# Altium schematic sheet 04_I2C_EEPROM.SchDoc
size A4
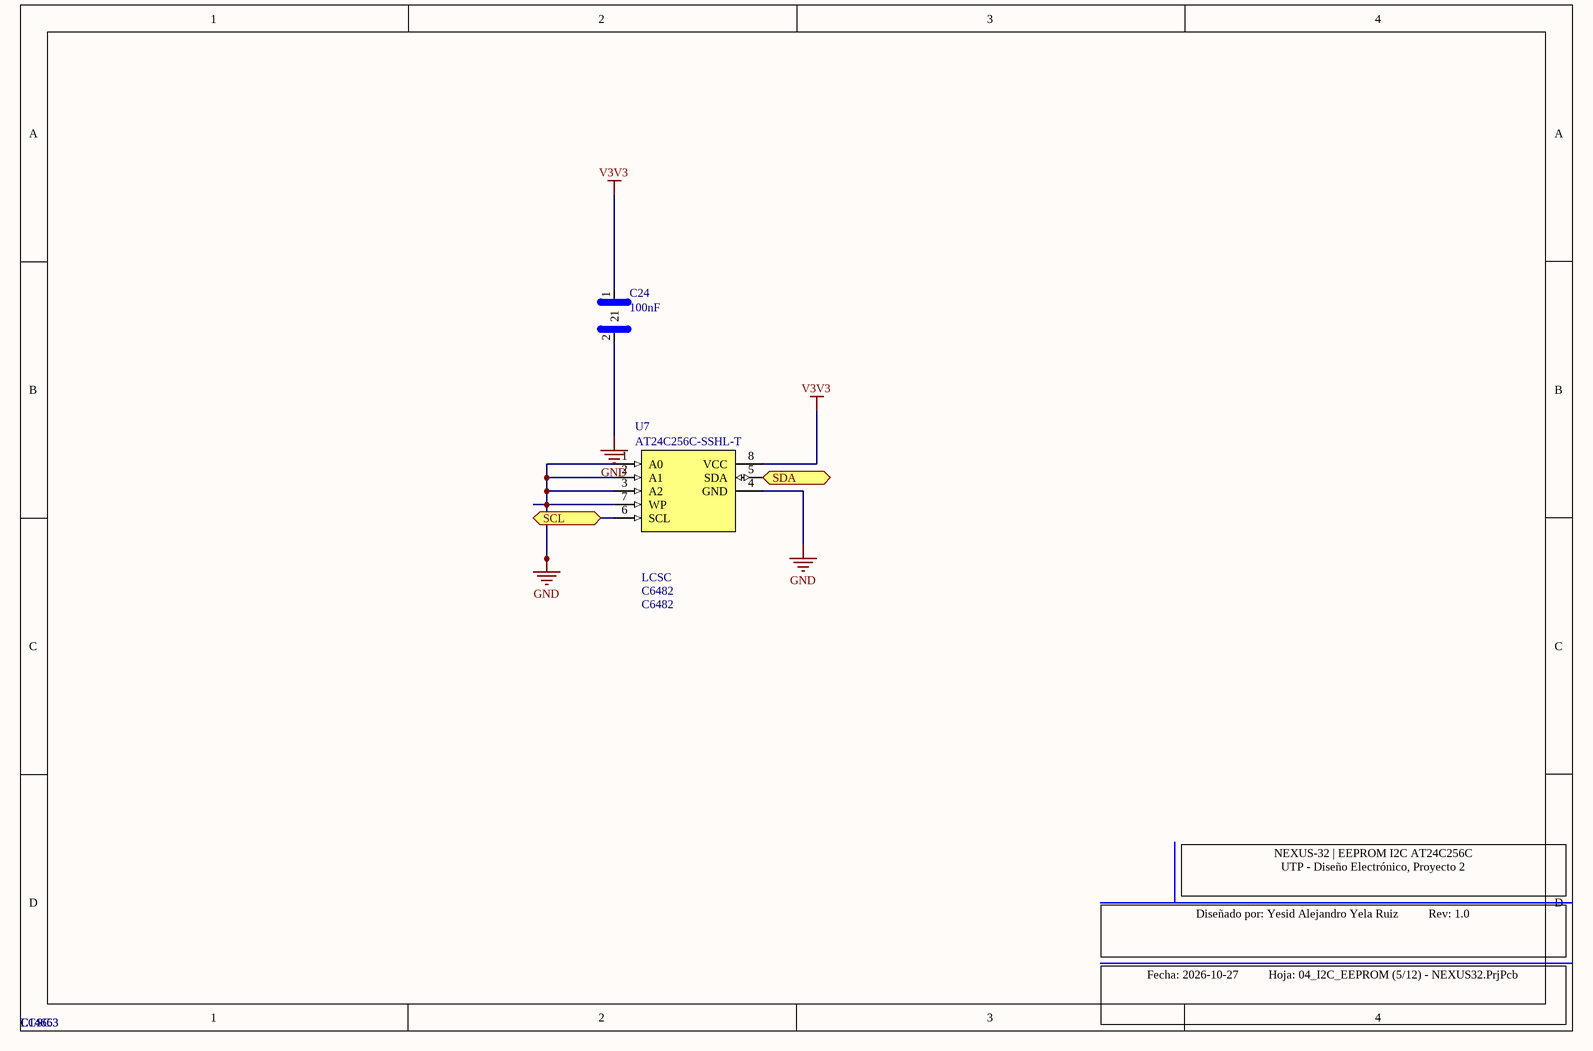
[diagram p0: 04_I2C_EEPROM.SchDoc]

## Parts
C24  100nF  Supplier 1: LCSC  Supplier Part Number 1: C14663  [R_0603]
U7  AT24C256C-SSHL-T  Supplier 1: LCSC  Supplier Part Number 1: C6482  [SOIC-8_3.9x4.9_P1.27]

## Ports
SCL (bidir), SDA (bidir)

## Nets
GND: C24.2 U7.1(A0) U7.2(A1) U7.3(A2) U7.4(GND) U7.7(WP)
V3V3: C24.1 U7.8(VCC)
SCL: U7.6(SCL) ; port SCL
SDA: U7.5(SDA) ; port SDA

## Notes on the sheet
- NEXUS-32 | EEPROM I2C AT24C256C
  UTP - Diseño Electrónico, Proyecto 2
- Diseñado por: Yesid Alejandro Yela Ruiz          Rev: 1.0
- Fecha: 2026-10-27          Hoja: 04_I2C_EEPROM (5/12) - NEXUS32.PrjPcb

## Library data of the parts
C24 = CAP_0603: Condensador ceramico SMD 0603; Manufacturer: YAGEO; Manufacturer Part Number: CC0603KRX7R9BB104; Datasheet: https://wmsc.lcsc.com/wmsc/upload/file/pdf/v2/lcsc/2206010045_UNI-ROYAL-Uniroyal-Elec-0603WAF1002T5E_C25804.pdf; LCSC Part #: C14663
U7 = AT24C256C-SSHL-T: EEPROM I2C 256Kbit SOIC-8 (Microchip AT24C256C-SSHL-T); Manufacturer: Microchip Technology; Manufacturer Part Number: AT24C256C-SSHL-T; LCSC Part #: C6482; Datasheet: https://ww1.microchip.com/downloads/en/DeviceDoc/Atmel-8568-SEEPROM-AT24C256C-Datasheet.pdf